# Altium schematic sheet Main.SchDoc
size A4; SheetNumber: 1; SheetTotal: 4
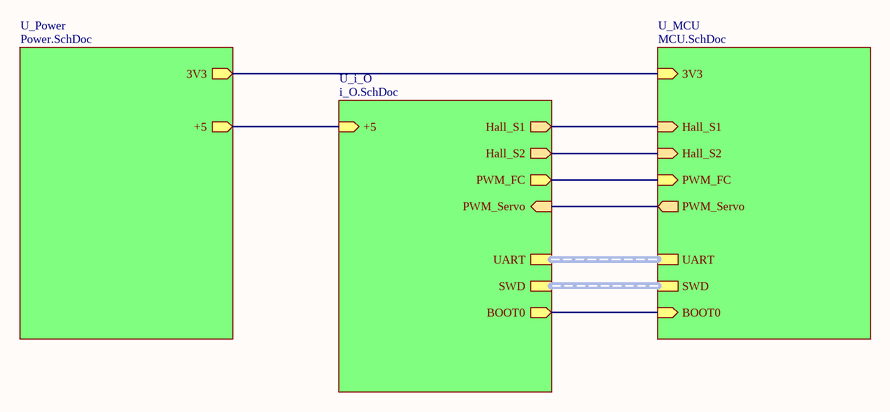
[diagram p0: Main.SchDoc]

## Sub-sheets
U_i_O = i_O.SchDoc: PWM_Servo (in), Hall_S1 (out), Hall_S2 (out), BOOT0 (out), UART (harness UART), SWD (harness SWD), +5 (in), PWM_FC (out)
U_MCU = MCU.SchDoc: Hall_S2 (in), Hall_S1 (in), PWM_Servo (out), BOOT0 (in), 3V3 (in), UART (harness UART), SWD (harness SWD), PWM_FC (in)
U_Power = Power.SchDoc: 3V3 (out), +5 (out)

## Nets
(unnamed): sheet U_Power/3V3, sheet U_MCU/3V3
(unnamed): sheet U_Power/+5, sheet U_i_O/+5
(unnamed): sheet U_i_O/PWM_Servo, sheet U_MCU/PWM_Servo
(unnamed): sheet U_i_O/Hall_S1, sheet U_MCU/Hall_S1
(unnamed): sheet U_i_O/Hall_S2, sheet U_MCU/Hall_S2
(unnamed): sheet U_i_O/BOOT0, sheet U_MCU/BOOT0
(unnamed): sheet U_i_O/PWM_FC, sheet U_MCU/PWM_FC

## Buses and harness runs
harness sheet U_i_O/SWD = sheet U_MCU/SWD
harness sheet U_i_O/UART = sheet U_MCU/UART